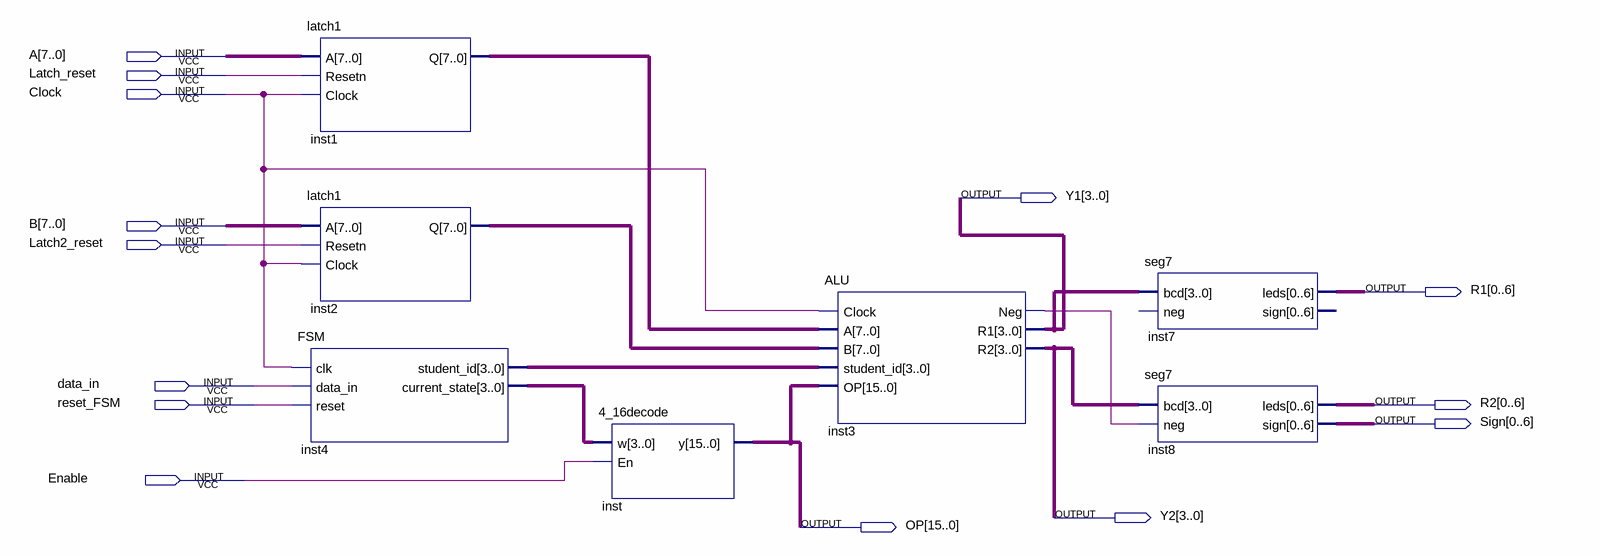
[diagram p0: schematic sheet]
// Quartus schematic problem1.bdf as structural Verilog: 7 symbols, 14 pins
module problem1 (
  input  [7:0] A,
  input  Latch_reset,
  input  Clock,
  input  [7:0] B,
  input  Latch2_reset,
  input  data_in,
  input  reset_FSM,
  input  Enable,
  output [3:0] Y1,
  output [0:6] R1,
  output [0:6] R2,
  output [0:6] Sign,
  output [3:0] Y2,
  output [15:0] OP
);

  wire inst3_neg;
  wire [3:0] inst4_current_state, inst4_student_id;
  wire [7:0] inst1_q, inst2_q;

  latch1 inst1 (.A(A), .Resetn(Latch_reset), .Clock(Clock), .Q(inst1_q));
  latch1 inst2 (.A(B), .Resetn(Latch2_reset), .Clock(Clock), .Q(inst2_q));
  FSM inst4 (
    .clk(Clock), .data_in(data_in), .reset(reset_FSM), .student_id(inst4_student_id),
    .current_state(inst4_current_state));
  \4_16decode  inst (.w(inst4_current_state), .En(Enable), .y(OP));
  ALU inst3 (
    .Clock(Clock), .A(inst1_q), .B(inst2_q), .student_id(inst4_student_id), .OP(OP), .Neg(inst3_neg),
    .R1(Y1), .R2(Y2));
  seg7 inst7 (.bcd(Y1), .leds(R1));  // open: neg, sign
  seg7 inst8 (.bcd(Y2), .neg(inst3_neg), .leds(R2), .sign(Sign));
endmodule
